# Altium schematic sheet ISOLATED-RELAYS.SchDoc
size A4; SheetNumber: 5; SheetTotal: 5
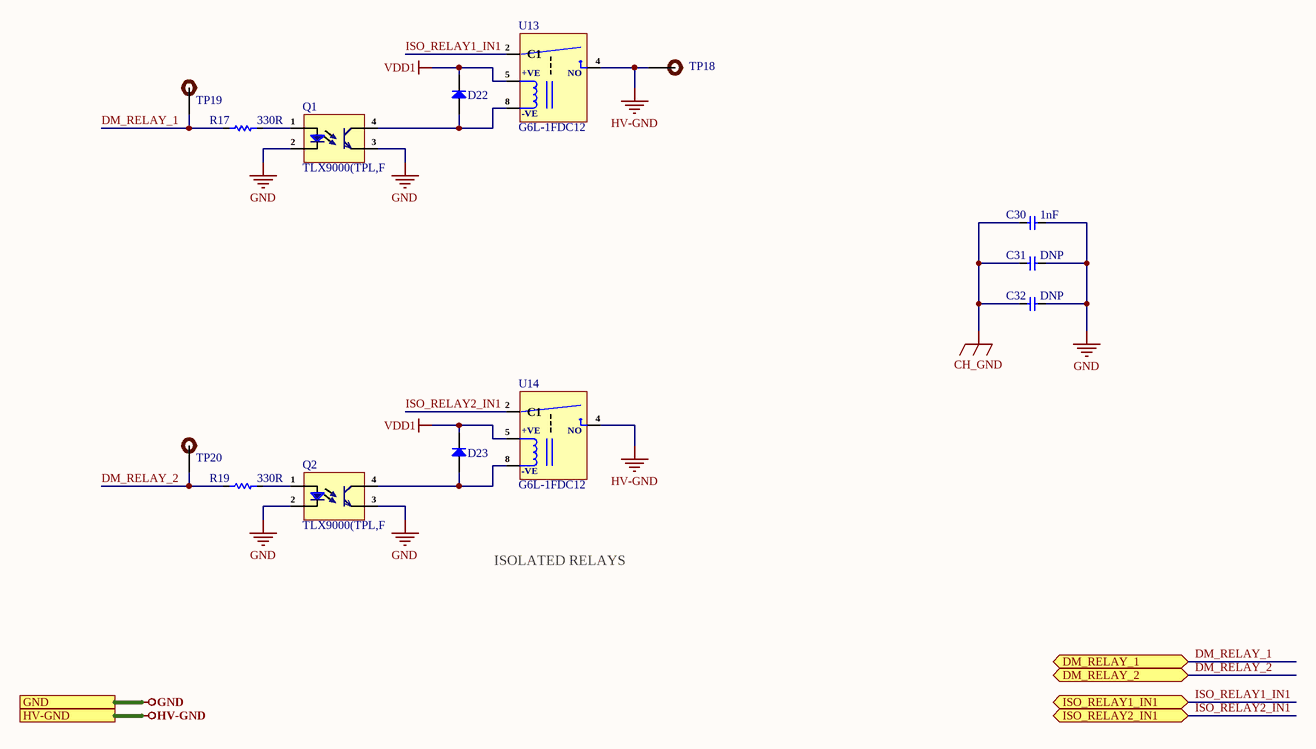
[diagram p0: ISOLATED-RELAYS.SchDoc]

## Parts
C30  1nF  [Cap-1206]
C31  DNP  [Cap-1206]
C32  DNP  [Cap-1206]
D22  LL4148-GS08  [SOD-80 MiniMELF]  (value not drawn)
D23  LL4148-GS08  [SOD-80 MiniMELF]  (value not drawn)
Q1  TLX9000(TPL,F  [4-SOIC (0.179", 4.55mm Width)]
Q2  TLX9000(TPL,F  [4-SOIC (0.179", 4.55mm Width)]
R17  330R  [Res-0201]
R19  330R  [Res-0201]
TP18  DNP  [Test-point]  (value not drawn)
TP19  DNP  [Test-point]  (value not drawn)
TP20  DNP  [Test-point]  (value not drawn)
U13  G6L-1FDC12  [G6L-1FDC12]
U14  G6L-1FDC12  [G6L-1FDC12]

## Ports
DM_RELAY_1 (bidir, see Top-Sheet[3B], Connector-USB-Current-Limit[4D]), DM_RELAY_2 (bidir, see Top-Sheet[3B], Connector-USB-Current-Limit[4D]), GND (see Top-Sheet[3B], Connector-USB-Current-Limit[2D], I2C-To-GPIO-Expander[1D], TEMP-HUMIDITY[1D]), HV-GND (see Top-Sheet[3B], Connector-USB-Current-Limit[2D]), ISO_RELAY1_IN1 (bidir, see Top-Sheet[3B], Connector-USB-Current-Limit[4D]), ISO_RELAY2_IN1 (bidir, see Top-Sheet[3B], Connector-USB-Current-Limit[4D])

## Nets
CH_GND: C30.1 C31.1 C32.1
GND: C30.2 C31.2 C32.2 Q1.2(Ca) Q1.3(E) Q2.2(Ca) Q2.3(E) ; port GND
HV-GND: TP18.1 U13.4(NO) U14.4(NO) ; port HV-GND
VDD1: D22.1(K) D23.1(K) U13.5(+VE) U14.5(+VE)
DM_RELAY_1: R17.1 TP19.1 ; port DM_RELAY_1
DM_RELAY_2: R19.1 TP20.1 ; port DM_RELAY_2
ISO_RELAY1_IN1: U13.2(C1) ; port ISO_RELAY1_IN1
ISO_RELAY2_IN1: U14.2(C1) ; port ISO_RELAY2_IN1
NetD22_2: D22.2(A) Q1.4(C) U13.8(-VE)
NetD23_2: D23.2(A) Q2.4(C) U14.8(-VE)
NetQ1_1: Q1.1(An) R17.2
NetQ2_1: Q2.1(An) R19.2

## Notes on the sheet
- ISOLATED RELAYS

## Library data of the parts
C30 = CL31B102KJHNNNE: CAP CER 1000PF 2KV X7R 1206; Manufacturer: Samsung; Tolerance: 10%; Voltage: 200V; Item Type: Capacitor; Supplier: Arrow Electronics; Supplier Part Number: CL31B102KJHNNNE; Manufacturer Part Number: CL31B102KJHNNNE; RoHS: Yes; Category: Ceramic Capacitors; Stock: 125192; Pricing: 1=0.3279, 10=0.1547, 25=0.1532, 100=0.0959, 250=0.095, 500=0.09, 1000=0.0734, 3000=0.0687, 6000=0.0643, 15000=0.0565, 30000=0.0502, 75000=0.0468 (USD); Mounting Technology: Surface Mount; Case/Package: 1206; Case Code (Metric): 3216; Case Code (Imperial): 1206; Min Operating Temperature: -55°C; Max Operating Temperature: 125°C; Value: 1nF; Packaging: Tape and Reel; Package Quantity: 1; Voltage Rating: 2kV; Dielectric: X7R; Series: CL; Construction: Flat; Length: 3.2mm; Width: 0.063inch; Height: 1.6mm; Thickness: 0.071inch; Depth: 1.6mm; Radiation Hardening: No; RoHS Compliant: Yes; ComponentLink1URL: https://datasheet.ciiva.com/25727/cl31b102kjhnnne-25727529.pdf?src-supplier=Digi-Key; ComponentLink1Description: https://datasheet.ciiva.com/25727/cl31b102kjhnnne-25727529.pdf?src-supplier=Digi-Key; ComponentLink2URL: https://datasheet.ciiva.com/26838/getdatasheetpartid-358436-26838883.pdf?src-supplier=Verical; ComponentLink2Description: https://datasheet.ciiva.com/26838/getdatasheetpartid-358436-26838883.pdf?src-supplier=Verical
C31 C32 = CL31B102KJHNNNE: CAP CER 1000PF 2KV X7R 1206; Manufacturer: Samsung; Value: 1nF; Tolerance: 10%; Voltage: 200V; Item Type: Capacitor; Supplier: Arrow Electronics; Supplier Part Number: CL31B102KJHNNNE; Manufacturer Part Number: CL31B102KJHNNNE; RoHS: Yes; Category: Ceramic Capacitors; Stock: 125192; Pricing: 1=0.3279, 10=0.1547, 25=0.1532, 100=0.0959, 250=0.095, 500=0.09, 1000=0.0734, 3000=0.0687, 6000=0.0643, 15000=0.0565, 30000=0.0502, 75000=0.0468 (USD); Mounting Technology: Surface Mount; Case/Package: 1206; Case Code (Metric): 3216; Case Code (Imperial): 1206; Min Operating Temperature: -55°C; Max Operating Temperature: 125°C; Packaging: Tape and Reel; Package Quantity: 1; Voltage Rating: 2kV; Dielectric: X7R; Series: CL; Construction: Flat; Length: 3.2mm; Width: 0.063inch; Height: 1.6mm; Thickness: 0.071inch; Depth: 1.6mm; Radiation Hardening: No; RoHS Compliant: Yes; ComponentLink1URL: https://datasheet.ciiva.com/25727/cl31b102kjhnnne-25727529.pdf?src-supplier=Digi-Key; ComponentLink1Description: https://datasheet.ciiva.com/25727/cl31b102kjhnnne-25727529.pdf?src-supplier=Digi-Key; ComponentLink2URL: https://datasheet.ciiva.com/26838/getdatasheetpartid-358436-26838883.pdf?src-supplier=Verical; ComponentLink2Description: https://datasheet.ciiva.com/26838/getdatasheetpartid-358436-26838883.pdf?src-supplier=Verical
D22 D23 = LL4148-GS08: DIODE GEN PURP 75V 300MA SOD80; Manufacturer: Vishay; Max Power Dissipation: 500mW; Forward Current: 150mA; Reverse Recovery Time: 8ns; Peak Non-Repetitive Surge Current: 2A; Max Repetitive Reverse Voltage (Vrrm): 100V; Primary Type: SWITCHING; Outside Diameter: 1.5mm; Supplier: Mouser; Supplier Part Number: 78-LL4148; Manufacturer Part Number: LL4148-GS08; RoHS: Yes; Category: Rectifier Diodes; Stock: 423192; Pricing: 1=0.14, 10=0.126, 50=0.126, 100=0.06, 500=0.037, 1000=0.028, 2500=0.022, 10000=0.019, 25000=0.017, 50000=0.015 (USD); Mounting Technology: Surface Mount; Pins: 2; Min Operating Temperature: -65°C; Max Operating Temperature: 175°C; Packaging: Cut Tape; Package Quantity: 1; Average Rectified Current: 300mA; Power Dissipation: 500mW; Max Forward Surge Current (Ifsm): 2A; Termination: SMD/SMT; Current Rating: 150mA; Voltage: 100V; Max Reverse Voltage (DC): 75V; Series: -; Reverse Recovery Time-Max: 8ns; Diameter: 1.6mm; Length: 3.7mm; Radiation Hardening: No; Lead Free: Lead Free; RoHS Compliant: Yes; Reach SVHC Compliant: Unknown; ComponentLink1URL: https://datasheet.ciiva.com/4246/ll4148-4246131.pdf?src-supplier=Arrow+Electronics; ComponentLink1Description: https://datasheet.ciiva.com/4246/ll4148-4246131.pdf?src-supplier=Arrow+Electronics; ComponentLink2URL: https://datasheet.ciiva.com/1243/1353494-1243008.pdf?src-supplier=Newark; ComponentLink2Description: https://datasheet.ciiva.com/1243/1353494-1243008.pdf?src-supplier=Newark; ComponentLink3URL: https://datasheet.ciiva.com/34301/891018-34301682.pdf?src-supplier=Jameco; ComponentLink3Description: https://datasheet.ciiva.com/34301/891018-34301682.pdf?src-supplier=Jameco; ComponentLink4URL: https://datasheet.ciiva.com/1181/1513919-1181029.pdf?src-supplier=Element14; ComponentLink4Description: https://datasheet.ciiva.com/1181/1513919-1181029.pdf?src-supplier=Element14; ComponentLink5URL: https://datasheet.ciiva.com/1243/1699941-1243749.pdf?src-supplier=Newark; ComponentLink5Description: https://datasheet.ciiva.com/1243/1699941-1243749.pdf?src-supplier=Newark; ComponentLink6URL: https://datasheet.ciiva.com/26311/1722544-26311744.pdf?src-supplier=Element14; ComponentLink6Description: https://datasheet.ciiva.com/26311/1722544-26311744.pdf?src-supplier=Element14; ComponentLink7URL: https://datasheet.ciiva.com/1181/1353494-1181031.pdf?src-supplier=Element14; ComponentLink7Description: https://datasheet.ciiva.com/1181/1353494-1181031.pdf?src-supplier=Element14; ComponentLink8URL: https://datasheet.ciiva.com/5829/1513919-5829997.pdf?src-supplier=Farnell; ComponentLink8Description: https://datasheet.ciiva.com/5829/1513919-5829997.pdf?src-supplier=Farnell; ComponentLink9URL: https://datasheet.ciiva.com/13946/ll4148-13946731.pdf?src-supplier=Digi-Key; ComponentLink9Description: https://datasheet.ciiva.com/13946/ll4148-13946731.pdf?src-supplier=Digi-Key; ComponentLink10URL: https://datasheet.ciiva.com/13946/ll4148-13946732.pdf?src-supplier=Digi-Key; ComponentLink10Description: https://datasheet.ciiva.com/13946/ll4148-13946732.pdf?src-supplier=Digi-Key; ComponentLink11URL: https://datasheet.ciiva.com/16298/ll4148-16298094.pdf?src-supplier=Future+Electronics; ComponentLink11Description: https://datasheet.ciiva.com/16298/ll4148-16298094.pdf?src-supplier=Future+Electronics; ComponentLink12URL: https://datasheet.ciiva.com/1181/1353494-1181030.pdf?src-supplier=Element14; ComponentLink12Description: https://datasheet.ciiva.com/1181/1353494-1181030.pdf?src-supplier=Element14; ComponentLink13URL: https://datasheet.ciiva.com/4434/ll4148-105055-4434938.pdf?src-supplier=Mouser; ComponentLink13Description: https://datasheet.ciiva.com/4434/ll4148-105055-4434938.pdf?src-supplier=Mouser; ComponentLink14URL: https://datasheet.ciiva.com/8287/ll4148-8287871.pdf?src-supplier=Avnet; ComponentLink14Description: https://datasheet.ciiva.com/8287/ll4148-8287871.pdf?src-supplier=Avnet; ComponentLink15URL: https://datasheet.ciiva.com/8287/ll4148-8287869.pdf?src-supplier=Avnet; ComponentLink15Description: https://datasheet.ciiva.com/8287/ll4148-8287869.pdf?src-supplier=Avnet; ComponentLink16URL: https://datasheet.ciiva.com/13946/ll4148-13946733.pdf?src-supplier=Digi-Key; ComponentLink16Description: https://datasheet.ciiva.com/13946/ll4148-13946733.pdf?src-supplier=Digi-Key; ComponentLink17URL: https://datasheet.ciiva.com/25936/ll4148-25936391.pdf?; ComponentLink17Description: https://datasheet.ciiva.com/25936/ll4148-25936391.pdf?
Q1 Q2 = TLX9000(TPL,F: TR COUPLER; SO4; AECQ; ROHS; T&R; Manufacturer: Toshiba; Supplier: Digi-Key; Supplier Part Number: 264-TLX9000(TPLFDKR-ND; Manufacturer Part Number: TLX9000(TPL,F; RoHS: No; Category: Optocouplers; Pricing: 1=3.15, 10=2.227, 100=1.8241, 500=1.53772, 1000=1.41046 (USD)
R17 R19 = RC0201DR-07330RL: RES 330 OHM 0.5% 1/20W 0201; Manufacturer: Yageo; Max Power Dissipation: 50mW; Temperature Coefficient: 200ppm/°C; Item Type: Resistor; Supplier 1: Digi-Key; Manufacturer Part Number: RC0201DR-07330RL; RoHS: Yes; Category: Chip SMD Resistors; Pricing 1: 10000=0.02267 (USD); Case/Package: 0201; Min Operating Temperature: -55°C; Max Operating Temperature: 125°C; Packaging: Tape and Reel; Value: 330R; Number of Terminations: 2; Tolerance: 0.5%; Features: Moisture Resistant; Series: RC; Length: 0.024inch; Width: 0.012inch; Height: 0.01inch; RoHS Compliant: Yes; ComponentLink1URL: http://www.yageo.com.tw/exep/pages/download/literatures/PYu-R_INT-thick_7.pdf?src-supplier=Digi-Key; ComponentLink1Description: http://www.yageo.com.tw/exep/pages/download/literatures/PYu-R_INT-thick_7.pdf?src-supplier=Digi-Key; Supplier Part Number 1: RC0201DR-07330RL-ND; LCSC Part Number: C851717
TP18-TP20 = TEST POINT: Test Point ON; Item Type: TEST POINT
U13 U14 = G6L-1FDC12: RELAY TELECOM SPST 1A 12VDC; Manufacturer: Omron; Supplier: Arrow Electronics; Supplier Part Number: G6L-1F-DC12; Manufacturer Part Number: G6L-1FDC12; RoHS: Yes; Category: Signal Relays; Stock: 764; Pricing: 1=3.229, 10=2.966, 25=2.652, 50=2.416, 100=2.239, 250=2.053, 500=1.91, 1000=1.756, 5000=1.705 (USD); ComponentLink1URL: https://datasheet.ciiva.com/2416/g6l-0614-2416511.pdf?src-supplier=Digi-Key; ComponentLink1Description: https://datasheet.ciiva.com/2416/g6l-0614-2416511.pdf?src-supplier=Digi-Key; ComponentLink2URL: https://datasheet.ciiva.com/15185/getdatasheetpartid-153492-15185645.pdf?src-supplier=Verical; ComponentLink2Description: https://datasheet.ciiva.com/15185/getdatasheetpartid-153492-15185645.pdf?src-supplier=Verical